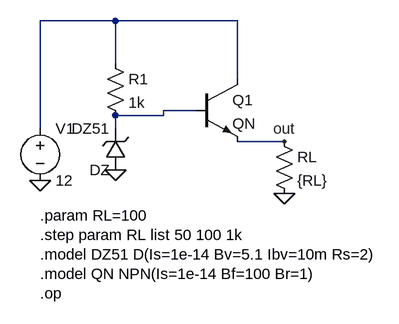
[diagram p0: schematic Ex10.asc]
Ex10.asc, the LTspice schematic file:
Version 4
SHEET 1 880 680
WIRE 60 216 60 50
WIRE 60 50 176 50
WIRE 176 50 176 116
WIRE 176 50 364 50
WIRE 364 50 364 140
WIRE 176 196 176 216
WIRE 176 196 250 196
WIRE 250 196 250 188
WIRE 250 188 300 188
WIRE 364 236 436 236
FLAG 436 236 out
FLAG 60 296 0
FLAG 176 280 0
FLAG 436 316 0
SYMBOL voltage 60 200 R0
SYMATTR InstName V1
SYMATTR Value 12
SYMBOL res 160 100 R0
SYMATTR InstName R1
SYMATTR Value 1k
SYMBOL zener 192 280 R180
SYMATTR InstName DZ
SYMATTR Value DZ51
SYMBOL npn 300 140 R0
SYMATTR InstName Q1
SYMATTR Value QN
SYMBOL res 420 220 R0
SYMATTR InstName RL
SYMATTR Value {RL}
TEXT 60 350 Left 2 !.param RL=100
TEXT 60 380 Left 2 !.step param RL list 50 100 1k
TEXT 60 410 Left 2 !.model DZ51 D(Is=1e-14 Bv=5.1 Ibv=10m Rs=2)
TEXT 60 440 Left 2 !.model QN NPN(Is=1e-14 Bf=100 Br=1)
TEXT 60 470 Left 2 !.op

The netlist it stands for:
* Ex10.asc
V1 N001 0 12
R1 N001 N002 1k
DZ 0 N002 DZ51
Q1 N001 N002 out 0 QN
RL out 0 {RL}
.model D D
.lib standard.dio
.model NPN NPN
.model PNP PNP
.lib standard.bjt
.param RL=100
.step param RL list 50 100 1k
.model DZ51 D(Is=1e-14 Bv=5.1 Ibv=10m Rs=2)
.model QN NPN(Is=1e-14 Bf=100 Br=1)
.op
.backanno
.end

* Results of the author's LTspice run, read from the files saved beside the schematic
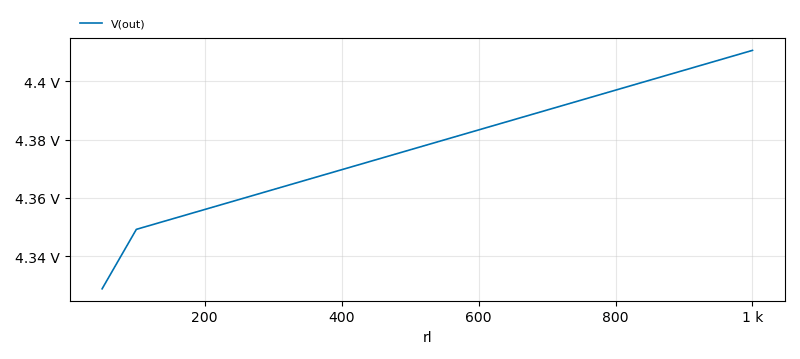
[diagram p1: Operating Point of Ex10.asc, plotted from the saved traces]
* Operating Point, 1 run:
*   V(out): 4.329 V at rl=50 , 4.411 V at rl=1 k, min 4.329 V, max 4.411 V